# Altium schematic sheet 4_Drivers.SchDoc
size 412 x 182 mm; SheetNumber: 1; SheetTotal: 4
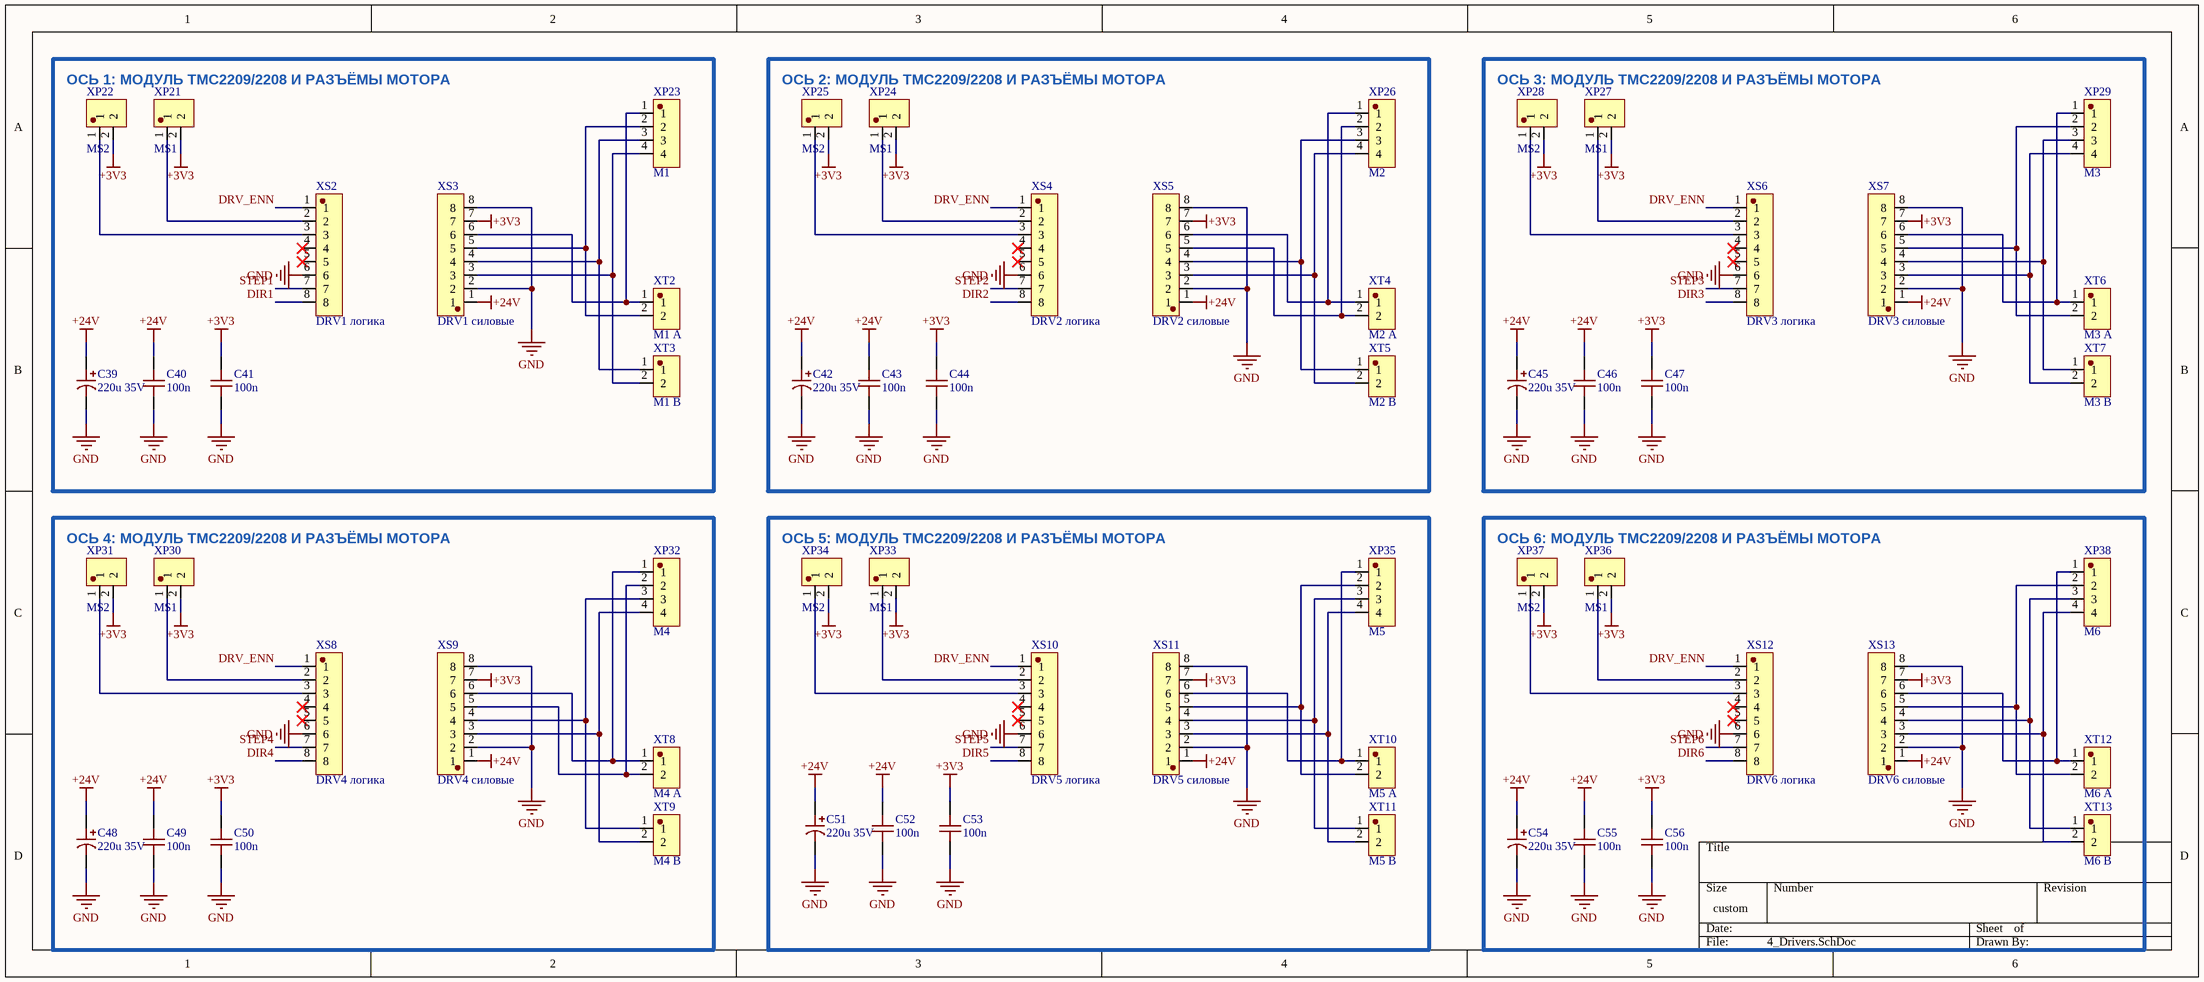
[diagram p0: 4_Drivers.SchDoc]

## Parts
C39  220u 35V  [CAP-TH_BD8.0-P3.50-D0.5-FD]
C40  100n  [C0603]
C41  100n  [C0603]
C42  220u 35V  [CAP-TH_BD8.0-P3.50-D0.5-FD]
C43  100n  [C0603]
C44  100n  [C0603]
C45  220u 35V  [CAP-TH_BD8.0-P3.50-D0.5-FD]
C46  100n  [C0603]
C47  100n  [C0603]
C48  220u 35V  [CAP-TH_BD8.0-P3.50-D0.5-FD]
C49  100n  [C0603]
C50  100n  [C0603]
C51  220u 35V  [CAP-TH_BD8.0-P3.50-D0.5-FD]
C52  100n  [C0603]
C53  100n  [C0603]
C54  220u 35V  [CAP-TH_BD8.0-P3.50-D0.5-FD]
C55  100n  [C0603]
C56  100n  [C0603]
XP21  MS1  [HDR-TH_2P-P2.54-V-M]
XP22  MS2  [HDR-TH_2P-P2.54-V-M]
XP23  M1  [HDR-TH_4P-P2.54-V-M]
XP24  MS1  [HDR-TH_2P-P2.54-V-M]
XP25  MS2  [HDR-TH_2P-P2.54-V-M]
XP26  M2  [HDR-TH_4P-P2.54-V-M]
XP27  MS1  [HDR-TH_2P-P2.54-V-M]
XP28  MS2  [HDR-TH_2P-P2.54-V-M]
XP29  M3  [HDR-TH_4P-P2.54-V-M]
XP30  MS1  [HDR-TH_2P-P2.54-V-M]
XP31  MS2  [HDR-TH_2P-P2.54-V-M]
XP32  M4  [HDR-TH_4P-P2.54-V-M]
XP33  MS1  [HDR-TH_2P-P2.54-V-M]
XP34  MS2  [HDR-TH_2P-P2.54-V-M]
XP35  M5  [HDR-TH_4P-P2.54-V-M]
XP36  MS1  [HDR-TH_2P-P2.54-V-M]
XP37  MS2  [HDR-TH_2P-P2.54-V-M]
XP38  M6  [HDR-TH_4P-P2.54-V-M]
XS2  DRV1 логика  [HDR-TH_PZ254V-11-08P-A40]
XS3  DRV1 силовые  [HDR-TH_PZ254V-11-08P-A40]
XS4  DRV2 логика  [HDR-TH_PZ254V-11-08P-A40]
XS5  DRV2 силовые  [HDR-TH_PZ254V-11-08P-A40]
XS6  DRV3 логика  [HDR-TH_PZ254V-11-08P-A40]
XS7  DRV3 силовые  [HDR-TH_PZ254V-11-08P-A40]
XS8  DRV4 логика  [HDR-TH_PZ254V-11-08P-A40]
XS9  DRV4 силовые  [HDR-TH_PZ254V-11-08P-A40]
XS10  DRV5 логика  [HDR-TH_PZ254V-11-08P-A40]
XS11  DRV5 силовые  [HDR-TH_PZ254V-11-08P-A40]
XS12  DRV6 логика  [HDR-TH_PZ254V-11-08P-A40]
XS13  DRV6 силовые  [HDR-TH_PZ254V-11-08P-A40]
XT2  M1 A  [CONN-TH_P3.50_KF350-3.5-2P]
XT3  M1 B  [CONN-TH_P3.50_KF350-3.5-2P]
XT4  M2 A  [CONN-TH_P3.50_KF350-3.5-2P]
XT5  M2 B  [CONN-TH_P3.50_KF350-3.5-2P]
XT6  M3 A  [CONN-TH_P3.50_KF350-3.5-2P]
XT7  M3 B  [CONN-TH_P3.50_KF350-3.5-2P]
XT8  M4 A  [CONN-TH_P3.50_KF350-3.5-2P]
XT9  M4 B  [CONN-TH_P3.50_KF350-3.5-2P]
XT10  M5 A  [CONN-TH_P3.50_KF350-3.5-2P]
XT11  M5 B  [CONN-TH_P3.50_KF350-3.5-2P]
XT12  M6 A  [CONN-TH_P3.50_KF350-3.5-2P]
XT13  M6 B  [CONN-TH_P3.50_KF350-3.5-2P]

## Blocks framed on the sheet
ОСЬ 1: МОДУЛЬ TMC2209/2208 И РАЗЪЁМЫ МОТОРА: C39-C41 XP21-XP23 XS2 XS3 XT2 XT3
ОСЬ 2: МОДУЛЬ TMC2209/2208 И РАЗЪЁМЫ МОТОРА: C42-C44 XP24-XP26 XS4 XS5 XT4 XT5
ОСЬ 3: МОДУЛЬ TMC2209/2208 И РАЗЪЁМЫ МОТОРА: C45-C47 XP27-XP29 XS6 XS7 XT6 XT7
ОСЬ 4: МОДУЛЬ TMC2209/2208 И РАЗЪЁМЫ МОТОРА: C48-C50 XP30-XP32 XS8 XS9 XT8 XT9
ОСЬ 5: МОДУЛЬ TMC2209/2208 И РАЗЪЁМЫ МОТОРА: C51-C53 XP33-XP35 XS10 XS11 XT10 XT11
ОСЬ 6: МОДУЛЬ TMC2209/2208 И РАЗЪЁМЫ МОТОРА: C54-C56 XP36-XP38 XS12 XS13 XT12 XT13

## Nets
+3V3: C41.1 C44.1 C47.1 C50.1 C53.1 C56.1 XP21.2 XP22.2 XP24.2 XP25.2 XP27.2 XP28.2 XP30.2 XP31.2 XP33.2 XP34.2 XP36.2 XP37.2 XS3.7 XS5.7 XS7.7 XS9.7 XS11.7 XS13.7
+24V: C39.1 C40.1 C42.1 C43.1 C45.1 C46.1 C48.1 C49.1 C51.1 C52.1 C54.1 C55.1 XS3.1 XS5.1 XS7.1 XS9.1 XS11.1 XS13.1
GND: C39.2 C40.2 C41.2 C42.2 C43.2 C44.2 C45.2 C46.2 C47.2 C48.2 C49.2 C50.2 C51.2 C52.2 C53.2 C54.2 C55.2 C56.2 XS2.6 XS3.2 XS3.8 XS4.6 XS5.2 XS5.8 XS6.6 XS7.2 XS7.8 XS8.6 XS9.2 XS9.8 XS10.6 XS11.2 XS11.8 XS12.6 XS13.2 XS13.8
DIR1: XS2.8
DIR2: XS4.8
DIR3: XS6.8
DIR4: XS8.8
DIR5: XS10.8
DIR6: XS12.8
DRV_ENN: XS2.1 XS4.1 XS6.1 XS8.1 XS10.1 XS12.1
STEP1: XS2.7
STEP2: XS4.7
STEP3: XS6.7
STEP4: XS8.7
STEP5: XS10.7
STEP6: XS12.7
NetXP21_1: XP21.1 XS2.2
NetXP22_1: XP22.1 XS2.3
NetXP23_1: XP23.1 XS3.6 XT2.1
NetXP23_2: XP23.2 XS3.5 XT2.2
NetXP23_3: XP23.3 XS3.4 XT3.1
NetXP23_4: XP23.4 XS3.3 XT3.2
NetXP24_1: XP24.1 XS4.2
NetXP25_1: XP25.1 XS4.3
NetXP26_1: XP26.1 XS5.6 XT4.1
NetXP26_2: XP26.2 XS5.5 XT4.2
NetXP26_3: XP26.3 XS5.4 XT5.1
NetXP26_4: XP26.4 XS5.3 XT5.2
NetXP27_1: XP27.1 XS6.2
NetXP28_1: XP28.1 XS6.3
NetXP29_1: XP29.1 XS7.6 XT6.1
NetXP29_2: XP29.2 XS7.5 XT6.2
NetXP29_3: XP29.3 XS7.4 XT7.1
NetXP29_4: XP29.4 XS7.3 XT7.2
NetXP30_1: XP30.1 XS8.2
NetXP31_1: XP31.1 XS8.3
NetXP32_1: XP32.1 XS9.6 XT8.1
NetXP32_2: XP32.2 XS9.5 XT8.2
NetXP32_3: XP32.3 XS9.4 XT9.1
NetXP32_4: XP32.4 XS9.3 XT9.2
NetXP33_1: XP33.1 XS10.2
NetXP34_1: XP34.1 XS10.3
NetXP35_1: XP35.1 XS11.6 XT10.1
NetXP35_2: XP35.2 XS11.5 XT10.2
NetXP35_3: XP35.3 XS11.4 XT11.1
NetXP35_4: XP35.4 XS11.3 XT11.2
NetXP36_1: XP36.1 XS12.2
NetXP37_1: XP37.1 XS12.3
NetXP38_1: XP38.1 XS13.6 XT12.1
NetXP38_2: XP38.2 XS13.5 XT12.2
NetXP38_3: XP38.3 XS13.4 XT13.1
NetXP38_4: XP38.4 XS13.3 XT13.2

Not connected (* = marked no-connect by the designer): XS2 4* 5*; XS4 4* 5*; XS6 4* 5*; XS8 4* 5*; XS10 4* 5*; XS12 4* 5*

## Library data of the parts
C39 C42 C45 C48 C51 C54 = 220UF35V8X12KM: Manufacturer: Econd; Value: 220uF; Manufacturer Part Number: 220uF35V8x12KM; LCSC Part: C49304872; Supplier: LCSC; Supplier Part Number: C49304872; JLCPCB Part Class: Extended Part; Datasheet: https://www.lcsc.com/datasheet/C49304872.pdf; Source: JLCEDA/EasyEDA Official Library (https://easyeda.com, https://lceda.cn)
C40 C41 C43 C44 C46 C47 C49 C50 C52 C53 C55 C56 = CL10B104KB8NNNC/0603: Manufacturer Part Number: CL10B104KB8NNNC/0603; LCSC Part: C9900007620; Supplier: LCSC; Supplier Part Number: C9900007620; Datasheet: https://www.lcsc.com/datasheet/C9900007620.pdf; Source: JLCEDA/EasyEDA Official Library (https://easyeda.com, https://lceda.cn)
XP21 XP22 XP24 XP25 XP27 XP28 XP30 XP31 XP33 XP34 XP36 XP37 = PZ254V-11-02P: Manufacturer: XFCN; Manufacturer Part Number: PZ254V-11-02P; LCSC Part: C492401; Supplier: LCSC; Supplier Part Number: C492401; JLCPCB Part Class: Extended Part; Datasheet: https://www.lcsc.com/datasheet/C492401.pdf; LCSC URL: https://lcsc.com/product-detail/New-Arrivals_XFCN-PZ254V-11-02P_C492401.html; Source: JLCEDA/EasyEDA Official Library (https://easyeda.com, https://lceda.cn)
XP23 XP26 XP29 XP32 XP35 XP38 = PZ254V-11-04P_C2691448: Manufacturer: XFCN; Manufacturer Part Number: PZ254V-11-04P; LCSC Part: C2691448; Supplier: LCSC; Supplier Part Number: C2691448; JLCPCB Part Class: Extended Part; Datasheet: https://www.lcsc.com/datasheet/C2691448.pdf; Source: JLCEDA/EasyEDA Official Library (https://easyeda.com, https://lceda.cn)
XS2-XS13 = PZ254V-11-08P-A40: Manufacturer: XFCN; Manufacturer Part Number: PZ254V-11-08P-A40; LCSC Part: C42419915; Supplier: LCSC; Supplier Part Number: C42419915; JLCPCB Part Class: Extended Part; Datasheet: https://www.lcsc.com/datasheet/C42419915.pdf; Source: JLCEDA/EasyEDA Official Library (https://easyeda.com, https://lceda.cn)
XT2-XT13 = KF350-3.5-2P: Manufacturer: KEFA; Manufacturer Part Number: KF350-3.5-2P; LCSC Part: C474892; Supplier: LCSC; Supplier Part Number: C474892; JLCPCB Part Class: Extended Part; Datasheet: https://www.lcsc.com/datasheet/C474892.pdf; LCSC URL: https://lcsc.com/product-detail/New-Quadratic-Unclassified-Data_Cixi-Kefa-Elec-KF350-3-5-2P_C474892.html; Source: JLCEDA/EasyEDA Official Library (https://easyeda.com, https://lceda.cn)